# EasyEDA Pro project trumpx-ipadrescreen-ipad34-c6ab9950.epro, schematic SCH_C
Board Name: IPAD3_4_TouchScreen_Board; Create Date: 2025-07-02; Page Name: P1; Project Name: IPADRESCREEN_IPAD3/4便携屏改造计划; Schematic Name: SCH_C; Update Date: 2025-07-02; Company: BSUIC; Page Size: A4; Version: V1.0
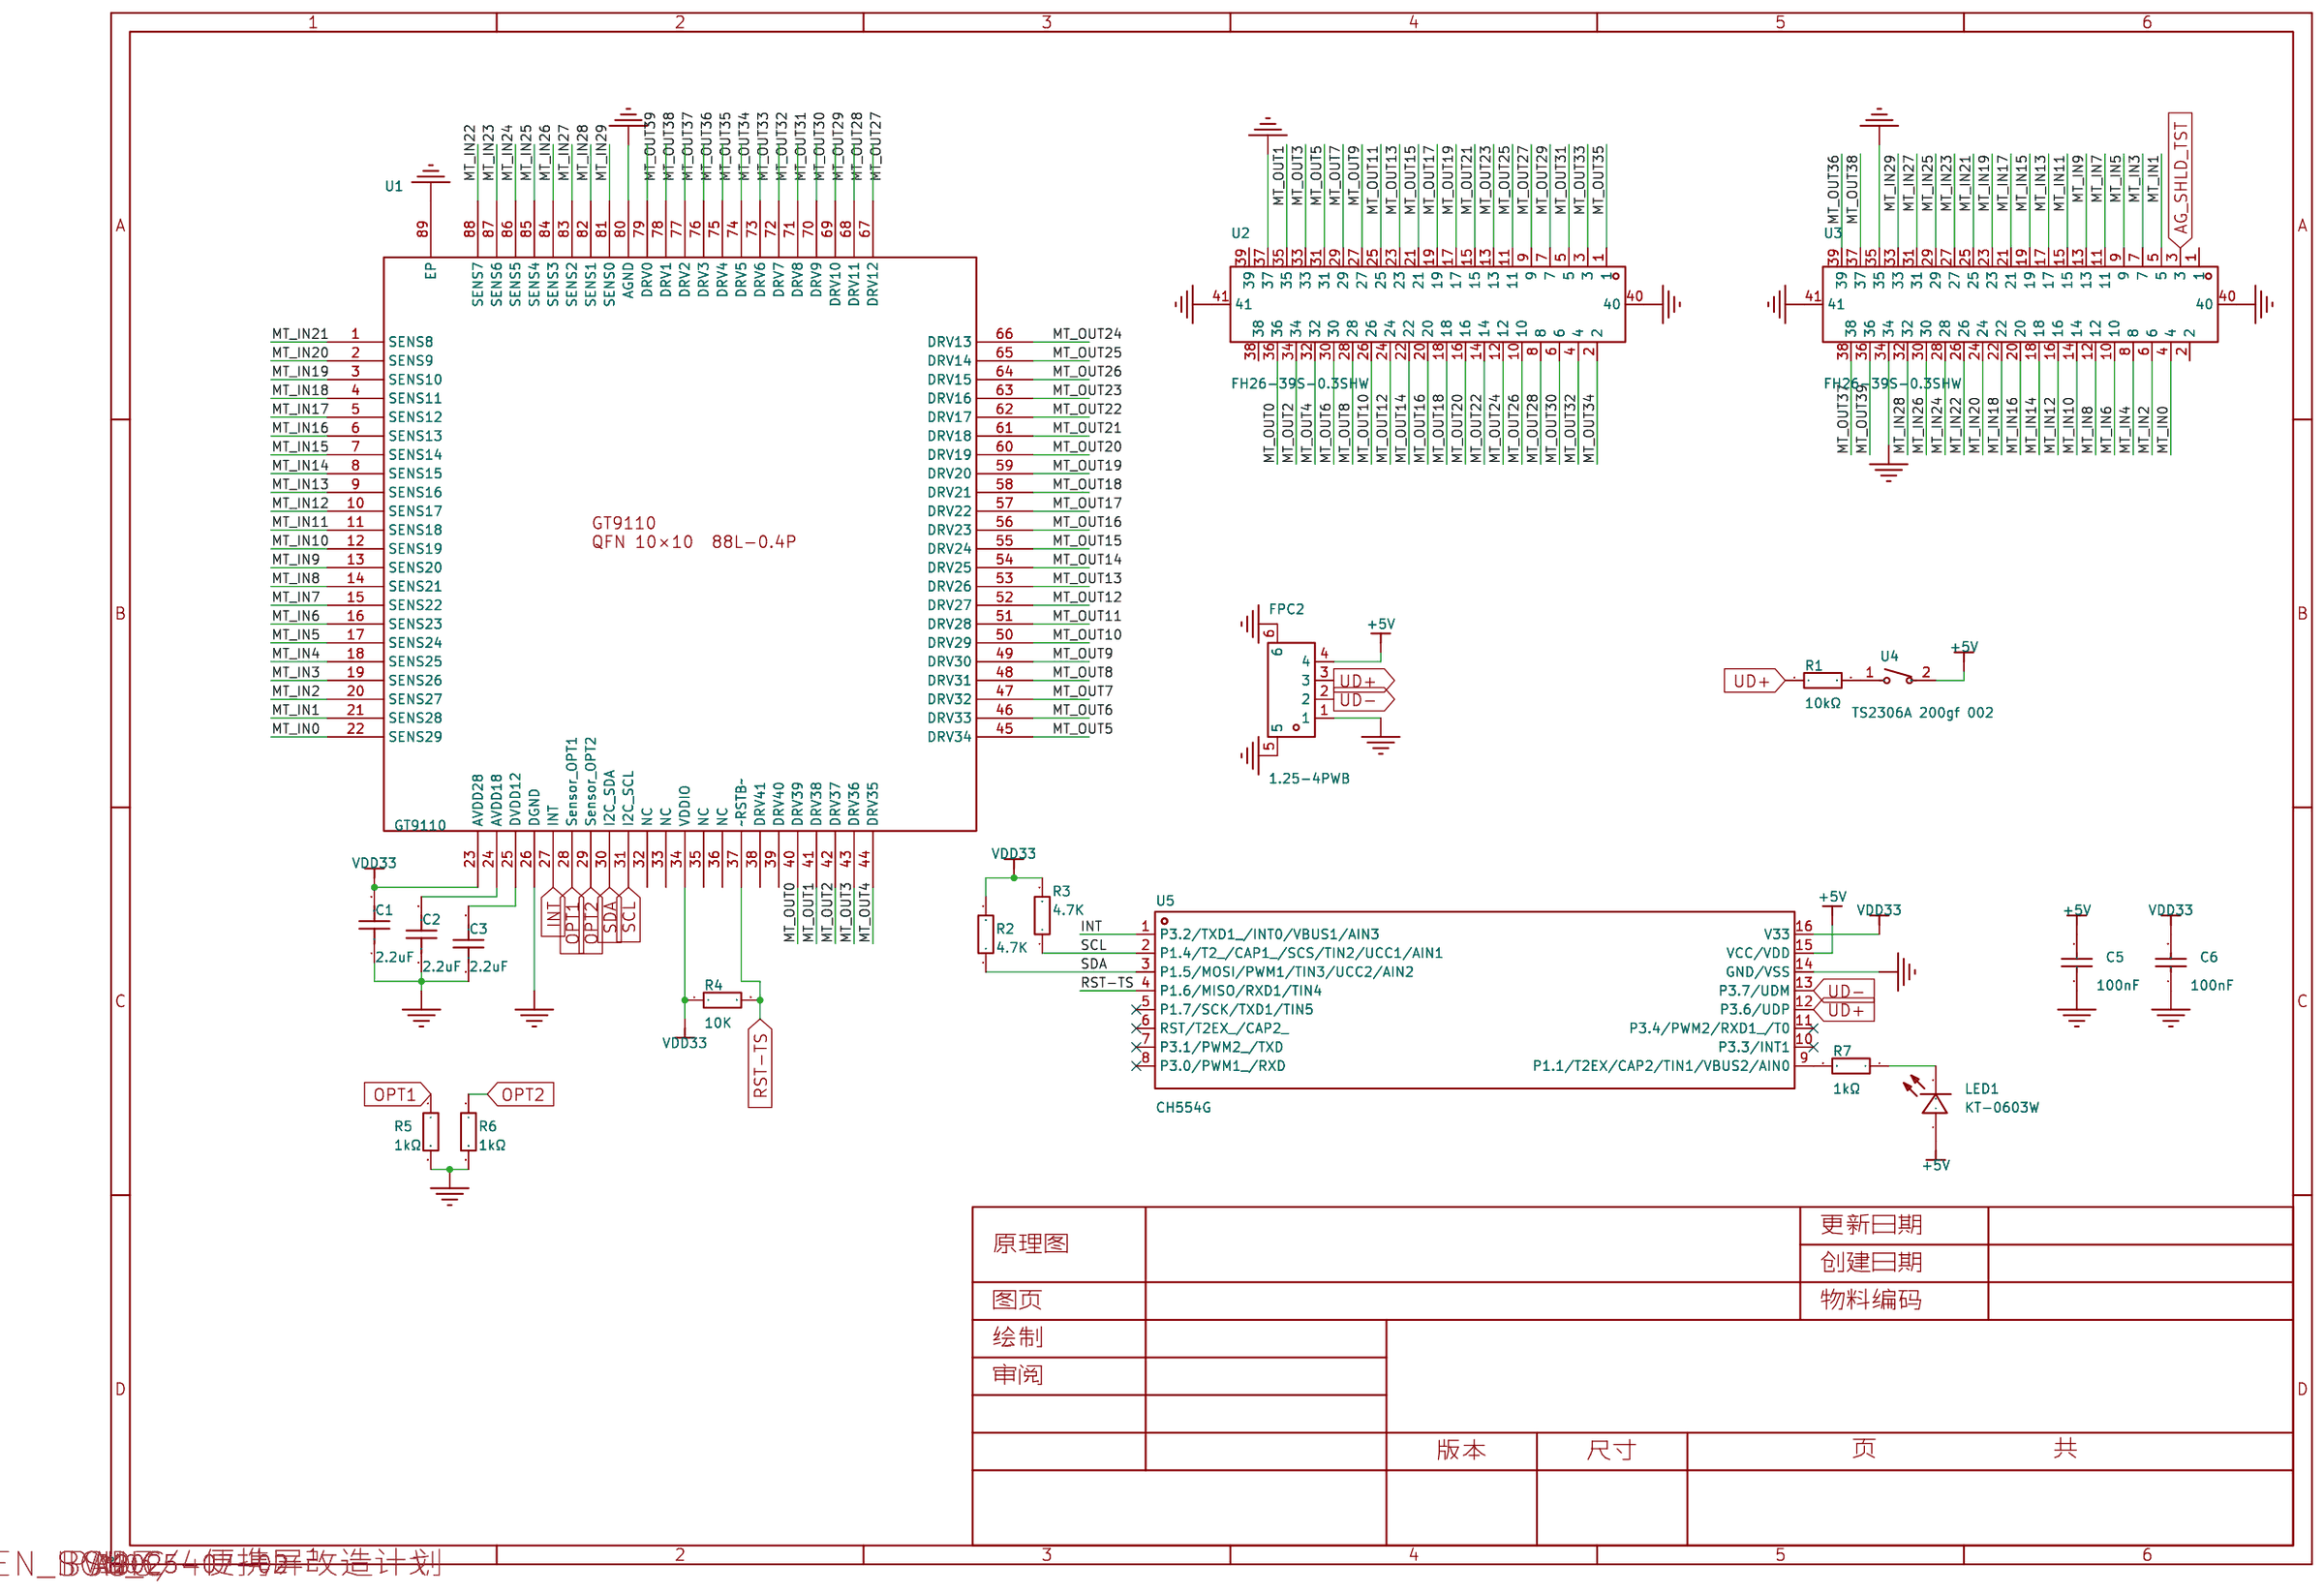
[diagram p5: schematic sheet]

## Parts
C1  2.2uF  [c0603_neo]
C2  2.2uF  [c0603_neo]
C3  2.2uF  [c0603_neo]
C5  100nF  [c0603_neo]
C6  100nF  [c0603_neo]
FPC2  1.25-4PWB  [CONN-SMD_1.25-4PWB]
LED1  KT-0603W  [LED0603]
R1  10kΩ  [r0603_neo]
R2  4.7K  [r0603_neo]
R3  4.7K  [r0603_neo]
R4  10K  [r0603_neo]
R5  1kΩ  [r0603_neo]
R6  1kΩ  [r0603_neo]
R7  1kΩ  [r0603_neo]
U1  GT9110  [GT9110]
U2  FH26-39S-0.3SHW  [CONN-SMD_FH26-39S-0.3SHW]
U3  FH26-39S-0.3SHW  [CONN-SMD_FH26-39S-0.3SHW]
U4  TS2306A 200gf 002  [SW-SMD_L3.0-W2.0-LS3.5]
U5  CH554G  [SOP-16_L10.0-W3.9-P1.27-LS6.0-BL]

## Library data of the parts
C1-C3 = CAP_0603: Supplier Footprint: 0603
C5 C6 = 0603B104K500NT: 容值:100nF;精度:±10%;额定电压:50V;材质(温度系数):X7R;; LCSC Part Name: 100nF ±10% 50V; Supplier Part: C30926; Manufacturer: FH(风华); Supplier Footprint: 0603; JLCPCB Part Class: 扩展库; Datasheet: https://atta.szlcsc.com/upload/public/pdf/source/20200305/C486355_26A10D38EF8C2A5C37091D0039909270.pdf; Supplier: LCSC; Tolerance: ±10%; Voltage Rated: 50V; Temperature Coefficient: X7R
FPC2 = 1.25-4PWB: 插针结构:1x4P;间距:1.25mm;安装方式:卧贴;参考系列:-;总PIN数:4P;排数:1;每排PIN数:4;行距:-;额定电流:-;工作温度范围:-40℃~+85℃;; LCSC Part Name: 1x4P 间距:1.25mm 卧贴; Supplier Part: C2905011; Manufacturer: DEALON(德艺隆); Supplier Footprint: SMD,P=1.25mm,卧贴; JLCPCB Part Class: Extended Part; Datasheet: https://atta.szlcsc.com/upload/public/pdf/source/20231123/1AE0876AE9C7DCFC0D68EAC4CBA881B0.pdf; Supplier: LCSC; Pins Structure: 1x4P; Pitch: 1.25mm; Mounting Style: 卧贴; Number of Pins: 4P; Number of Rows: 1; Number of PINs Per Row: 4; Operating Temperature Range: -40℃~+85℃
LED1 = KT-0603W: 发光颜色:白色;; LCSC Part Name: 0603 白灯 高亮; Supplier Part: C2290; Manufacturer: KENTO; Supplier Footprint: 0603; JLCPCB Part Class: 基础库; Datasheet: https://atta.szlcsc.com/upload/public/pdf/source/20221101/4C23D5C85BA051E44A00B833D0A41468.pdf; Supplier: LCSC; Emitted Color: 白色
R1 = 0603WAF1002T5E: 电阻类型:厚膜电阻;阻值:10kΩ;精度:±1%;功率:100mW;最大工作电压:75V;温度系数:±100ppm/℃;; LCSC Part Name: 厚膜电阻 10kΩ ±1% 100mW; Supplier Part: C25804; Manufacturer: UNI-ROYAL(厚声); Supplier Footprint: 0603; JLCPCB Part Class: 基础库; Datasheet: https://atta.szlcsc.com/upload/public/pdf/source/20200306/C422600_1E6D84923E4A46A82E41ADD87F860B5C.pdf; Supplier: LCSC; Type: 厚膜电阻; Tolerance: ±1%; Power(Watts): 100mW; Overload Voltage (Max): 75V; Temperature Coefficient: ±100ppm/℃; Operating Temperature Range: -55℃~+155℃
R2-R4 = Res_0603: Supplier Footprint: 0603
R5-R7 = 0603WAF1001T5E: 电阻类型:厚膜电阻;阻值:1kΩ;精度:±1%;功率:100mW;最大工作电压:75V;温度系数:±100ppm/℃;; LCSC Part Name: 1kΩ ±1% 100mW 厚膜电阻; Supplier Part: C21190; Manufacturer: UNI-ROYAL(厚声); Supplier Footprint: 0603; JLCPCB Part Class: 基础库; Datasheet: https://atta.szlcsc.com/upload/public/pdf/source/20200306/C422600_1E6D84923E4A46A82E41ADD87F860B5C.pdf; Supplier: LCSC; Type: 厚膜电阻; Tolerance: ±1%; Power(Watts): 100mW; Overload Voltage (Max): 75V; Temperature Coefficient: ±100ppm/℃; Operating Temperature Range: -55℃~+155℃
U1 = GT9110
U2 U3 = FH26-39S-0.3SHW: LCSC Part Name: 39P 间距0.3mm; Supplier Part: C2836943; JLCPCB Part Class: 扩展库; Datasheet: https://atta.szlcsc.com/upload/public/pdf/source/20210701/C2836943_89279797D5F7C307E7A8149B9D8203B0.pdf; Supplier: LCSC
U4 = TS2306A 200gf 002: 电路结构:单刀单掷;按钮形状:圆形按钮;作用力:200gf;安装方式:立贴;开关长度:3mm;开关宽度:2mm;开关高度:0.6mm;带支架:不带;触点电流:50mA;额定电压(DC):5V;额定功率:0.25W;绝缘电阻:100MΩ;带灯:无;机械寿命:30万次;; LCSC Part Name: 薄膜开关 2*3*0.6mm 蓝牙耳机/开机按键 两脚 黄膜黑点 200gf; Supplier Part: C5363482; Manufacturer: SHOU HAN(首韩); Supplier Footprint: SMD; JLCPCB Part Class: 扩展库; Datasheet: https://atta.szlcsc.com/upload/public/pdf/source/20230321/144662D432400ADC228EB2A996730BBD.pdf; Supplier: LCSC; Circuit: 单刀单掷; Actuator Style: 圆形按钮; Operating Force: 200gf; Mounting Style: 立贴; Switch Length: 3mm; Switch Width: 2mm; Switch Height: 0.6mm; Strike Gundam: 不带; Contact Current: 50mA; Voltage Rating (DC): 5V; Power Rating: 0.25W; Insulation Resistance: 100MΩ; Actuator/Cap Color: 黄色; With Lamp: 无; Mechanical Life: 30万次; Operating Temperature: -40℃~+80℃
U5 = CH554G: CPU内核:51系列;程序存储容量:16KB;RAM总容量:1.25KB;GPIO端口数量:-;工作电压范围:3.3V~5V;CPU最大主频:24MHz;程序存储器类型:FLASH;; Supplier Part: C114295; Manufacturer: WCH(南京沁恒); Supplier Footprint: SOP-16; JLCPCB Part Class: 扩展库; Datasheet: https://atta.szlcsc.com/upload/public/pdf/source/20200819/C114295_E9D53870A65CF2BB015F3F56842BBF5E.pdf; Supplier: LCSC; CPU Core: 51系列; Program Storage Size: 16KB; RAM Size: 1.25KB; Operating Voltage Range: 3.3V~5V; CPU Maximum Speed: 24MHz; Program Memory Type: FLASH; Operating Temperature Range: -40℃~+85℃; ADC (Bit): 8bit; PWM (Bit): 8bit; 16Bit Timer: 3; UART/USART: 2; SPI: 1; Universal Serial Bus: 有; Peripheral/Function: DMA；看门狗；CCP捕获/比较；触控按键; Watchdog: 有; CCP Capture/Compare: 有; Direct Memory Access: 有; Internal Oscillator: 有

## Nets
+5V: C5.2 FPC2.4 LED1.1(A) U4.2(A&apos;) U5.15(VCC/VDD)
GND: C1.1 C2.1 C3.1 C5.1 C6.1 FPC2.1 FPC2.5 FPC2.6 R5.2 R6.2 U1.26(DGND) U1.80(AGND) U1.89(EP) U2.37 U2.40 U2.41 U3.34 U3.35 U3.40 U3.41 U5.14(GND/VSS)
VDD33: C1.2 C6.2 R2.2 R3.2 R4.1 U1.23(AVDD28) U1.34(VDDIO) U5.16(V33)
AG_SHLD_TST: U3.3
INT: U1.27(INT) U5.1(P3.2/TXD1_/INT0/VBUS1/AIN3)
MT_IN0: U1.22(SENS29) U3.4
MT_IN1: U1.21(SENS28) U3.5
MT_IN2: U1.20(SENS27) U3.6
MT_IN3: U1.19(SENS26) U3.7
MT_IN4: U1.18(SENS25) U3.8
MT_IN5: U1.17(SENS24) U3.9
MT_IN6: U1.16(SENS23) U3.10
MT_IN7: U1.15(SENS22) U3.11
MT_IN8: U1.14(SENS21) U3.12
MT_IN9: U1.13(SENS20) U3.13
MT_IN10: U1.12(SENS19) U3.14
MT_IN11: U1.11(SENS18) U3.15
MT_IN12: U1.10(SENS17) U3.16
MT_IN13: U1.9(SENS16) U3.17
MT_IN14: U1.8(SENS15) U3.18
MT_IN15: U1.7(SENS14) U3.19
MT_IN16: U1.6(SENS13) U3.20
MT_IN17: U1.5(SENS12) U3.21
MT_IN18: U1.4(SENS11) U3.22
MT_IN19: U1.3(SENS10) U3.23
MT_IN20: U1.2(SENS9) U3.24
MT_IN21: U1.1(SENS8) U3.25
MT_IN22: U1.88(SENS7) U3.26
MT_IN23: U1.87(SENS6) U3.27
MT_IN24: U1.86(SENS5) U3.28
MT_IN25: U1.85(SENS4) U3.29
MT_IN26: U1.84(SENS3) U3.30
MT_IN27: U1.83(SENS2) U3.31
MT_IN28: U1.82(SENS1) U3.32
MT_IN29: U1.81(SENS0) U3.33
MT_OUT0: U1.40(DRV39) U2.36
MT_OUT1: U1.41(DRV38) U2.35
MT_OUT2: U1.42(DRV37) U2.34
MT_OUT3: U1.43(DRV36) U2.33
MT_OUT4: U1.44(DRV35) U2.32
MT_OUT5: U1.45(DRV34) U2.31
MT_OUT6: U1.46(DRV33) U2.30
MT_OUT7: U1.47(DRV32) U2.29
MT_OUT8: U1.48(DRV31) U2.28
MT_OUT9: U1.49(DRV30) U2.27
MT_OUT10: U1.50(DRV29) U2.26
MT_OUT11: U1.51(DRV28) U2.25
MT_OUT12: U1.52(DRV27) U2.24
MT_OUT13: U1.53(DRV26) U2.23
MT_OUT14: U1.54(DRV25) U2.22
MT_OUT15: U1.55(DRV24) U2.21
MT_OUT16: U1.56(DRV23) U2.20
MT_OUT17: U1.57(DRV22) U2.19
MT_OUT18: U1.58(DRV21) U2.18
MT_OUT19: U1.59(DRV20) U2.17
MT_OUT20: U1.60(DRV19) U2.16
MT_OUT21: U1.61(DRV18) U2.15
MT_OUT22: U1.62(DRV17) U2.14
MT_OUT23: U1.63(DRV16) U2.13
MT_OUT24: U1.66(DRV13) U2.12
MT_OUT25: U1.65(DRV14) U2.11
MT_OUT26: U1.64(DRV15) U2.10
MT_OUT27: U1.67(DRV12) U2.9
MT_OUT28: U1.68(DRV11) U2.8
MT_OUT29: U1.69(DRV10) U2.7
MT_OUT30: U1.70(DRV9) U2.6
MT_OUT31: U1.71(DRV8) U2.5
MT_OUT32: U1.72(DRV7) U2.4
MT_OUT33: U1.73(DRV6) U2.3
MT_OUT34: U1.74(DRV5) U2.2
MT_OUT35: U1.75(DRV4) U2.1
MT_OUT36: U1.76(DRV3) U3.39
MT_OUT37: U1.77(DRV2) U3.38
MT_OUT38: U1.78(DRV1) U3.37
MT_OUT39: U1.79(DRV0) U3.36
OPT1: R5.1 U1.28(Sensor_OPT1)
OPT2: R6.1 U1.29(Sensor_OPT2)
RST-TS: R4.2 U1.37(~RSTB~) U5.4(P1.6/MISO/RXD1/TIN4)
SCL: R3.1 U1.31(I2C_SCL) U5.2(P1.4/T2_/CAP1_/SCS/TIN2/UCC1/AIN1)
SDA: R2.1 U1.30(I2C_SDA) U5.3(P1.5/MOSI/PWM1/TIN3/UCC2/AIN2)
UD+: FPC2.3 R1.1 U5.12(P3.6/UDP)
UD-: FPC2.2 U5.13(P3.7/UDM)
$1N6411: C2.2 U1.24(AVDD18)
$1N6412: C3.2 U1.25(DVDD12)
$1N6447: R1.2 U4.1(A)
$1N6516: R7.2 U5.9(P1.1/T2EX/CAP2/TIN1/VBUS2/AIN0)
$1N6523: LED1.2(K) R7.1

Not connected (* = marked no-connect by the designer): U1 32(NC) 33(NC) 35(NC) 36(NC) 38(DRV41) 39(DRV40); U2 38 39; U3 1 2; U5 5(P1.7/SCK/TXD1/TIN5)* 6(RST/T2EX_/CAP2_)* 7(P3.1/PWM2_/TXD)* 8(P3.0/PWM1_/RXD)* 10(P3.3/INT1)* 11(P3.4/PWM2/RXD1_/T0)*
